# Altium schematic sheet RC, TELEMETRY, GPS & PERIPHERALS.SchDoc
size A; SheetNumber: 5; SheetTotal: 5
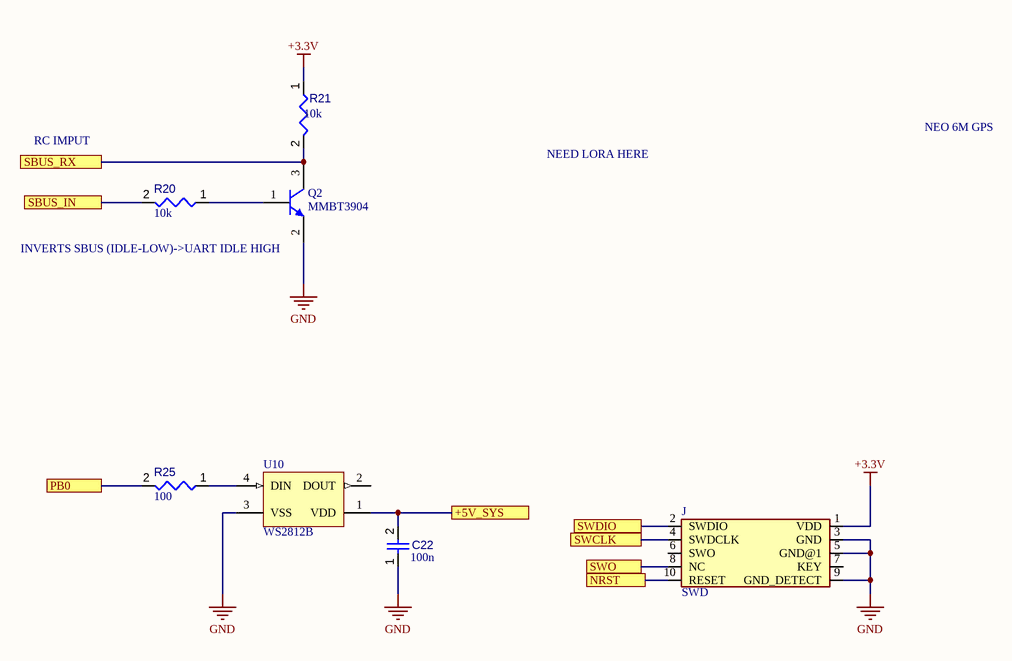
[diagram p0: RC, TELEMETRY, GPS & PERIPHERALS.SchDoc]

## Parts
C22  value 100n  [CAPC1608X90X40NL10T20]  (hidden comment: Capacitor 100 nF +/-10% 50 V 0603)
J  SWD  [2X10_BOXHEADER]
Q2  MMBT3904  [FAIR-SOT23-3_V]
R20  100R2F  [RESC0402(1005)_L]  (value not drawn)
R21  100R2F  [RESC0402(1005)_L]  (value not drawn)
R25  100R2F  [RESC0402(1005)_L]  (value not drawn)
U10  WS2812B  [ADAI-WS2812B_V]

## Ports
+5V_SYS, NRST, PB0, SBUS_IN, SBUS_RX, SWCLK, SWDIO, SWO

## Nets
+3.3V: J.1(VDD) R21.1
GND: C22.1 J.3(GND) J.5(GND@1) J.9(GND_DETECT) Q2.2(E) U10.3(VSS)
+5V_SYS: C22.2 U10.1(VDD) ; port +5V_SYS
NRST: J.10(RESET) ; port NRST
PB0: R25.2 ; port PB0
SBUS_IN: R20.2 ; port SBUS_IN
SBUS_RX: Q2.3(C) R21.2 ; port SBUS_RX
SWCLK: J.4(SWDCLK) ; port SWCLK
SWDIO: J.2(SWDIO) ; port SWDIO
SWO: J.8(NC) ; port SWO
NetQ2_1: Q2.1(B) R20.1
NetR25_1: R25.1 U10.4(DIN)

Not connected (* = marked no-connect by the designer): J 6(SWO) 7(KEY); U10 2(DOUT)

## Notes on the sheet
- RC IMPUT
- NEED LORA HERE
- NEO 6M GPS
- INVERTS SBUS (IDLE-LOW)->UART IDLE HIGH
- (in symbol CMP-009-00065-2) 10k; 100

## Library data of the parts
C22 = CMP-001-00017-6: Chip Capacitor, 100 nF, +/- 10%, 50 V, 0603 (1608 Metric); Voltage Rating: 50V; Capacitor Type: Ceramic; Tolerance: 10%; Mounting Technology: SM; Max Operating Temperature: 125°C; RoHS Compliant: True; Pins: 2; Case/Package: 0603; Min Operating Temperature: -55°C
J = CMP-009-000001-1: SWD WRITEON W/DISP .75X1.4 LAB; MF: 3M; Design Item ID: SWD; Price: None; Pin Count: 10; Source: SnapEDAsch.SchLib; SnapEDA_Link: https://www.snapeda.com/parts/SWD/3M%20%28TC%29/view-part/172681/?ref=snap; Value: *; Component Type: Standard; Availability: Unavailable; MP: SWD; Package: None
Q2 = CMP-014-00026-2: NPN General Purpose Amplifier, 40 V, 0.2 A, -55 to 150 degC, 3-Pin SOT23, RoHS, Tape and Reel; Manufacturer: Fairchild Semiconductor; Package Version: Rev. 12, 03/2016; Elements: 1; Power: 625mW; hFE Min: 100; Vce Max: 300mV; Frequency: 300MHz; Pins: 3; Package Description: 3-Pin Small Outline Transistor, Body 2.92 x 1.325 mm, Pitch 0.95 mm; RoHS Compliant: True; Package Quantity: 3000; Manufacturer URL: https://www.fairchildsemi.com/; Packaging: TapeandReel; Min Operating Temperature: -55°C; Max Operating Temperature: 150°C; Mounting Technology: SM; Case/Package: TO-236-3; Package Reference: SOT23-3; Datasheet Version: Rev. 1.1.0, 10/2014; Datasheet URL: https://www.fairchildsemi.com/datasheets/MM/MMBT3904.pdf; Package URL: http://www.fairchildsemi.com/dwg/MA/MA03D.pdf
R20 R21 R25 = CMP-009-00065-2: 100R 0.063W 1% 0402 (1005 Metric)  SMD; Power: 63mW; Tolerance: 1%; Case/Package: 0402; Pins: 2; Mounting Technology: SMT
U10 = CMP-007-00035-2: Intelligent Control LED Integrated Light Source, 3.5 to 5.3 V, -25 to 80 degC, 4-Pin SMD, RoHS, Bulk; Manufacturer: Adafruit Industries; Datasheet URL: https://cdn-shop.adafruit.com/datasheets/WS2812B.pdf; Manufacturer URL: https://www.adafruit.com/; Datasheet Version: May-13; Case/Package: WS2812B; Mounting Technology: SM; RoHS Compliant: False; Package Description: 4-Pin Surface Mount Device, Body 5 x 5 mm, Pitch 3.3 mm; Package Reference: WS2812B